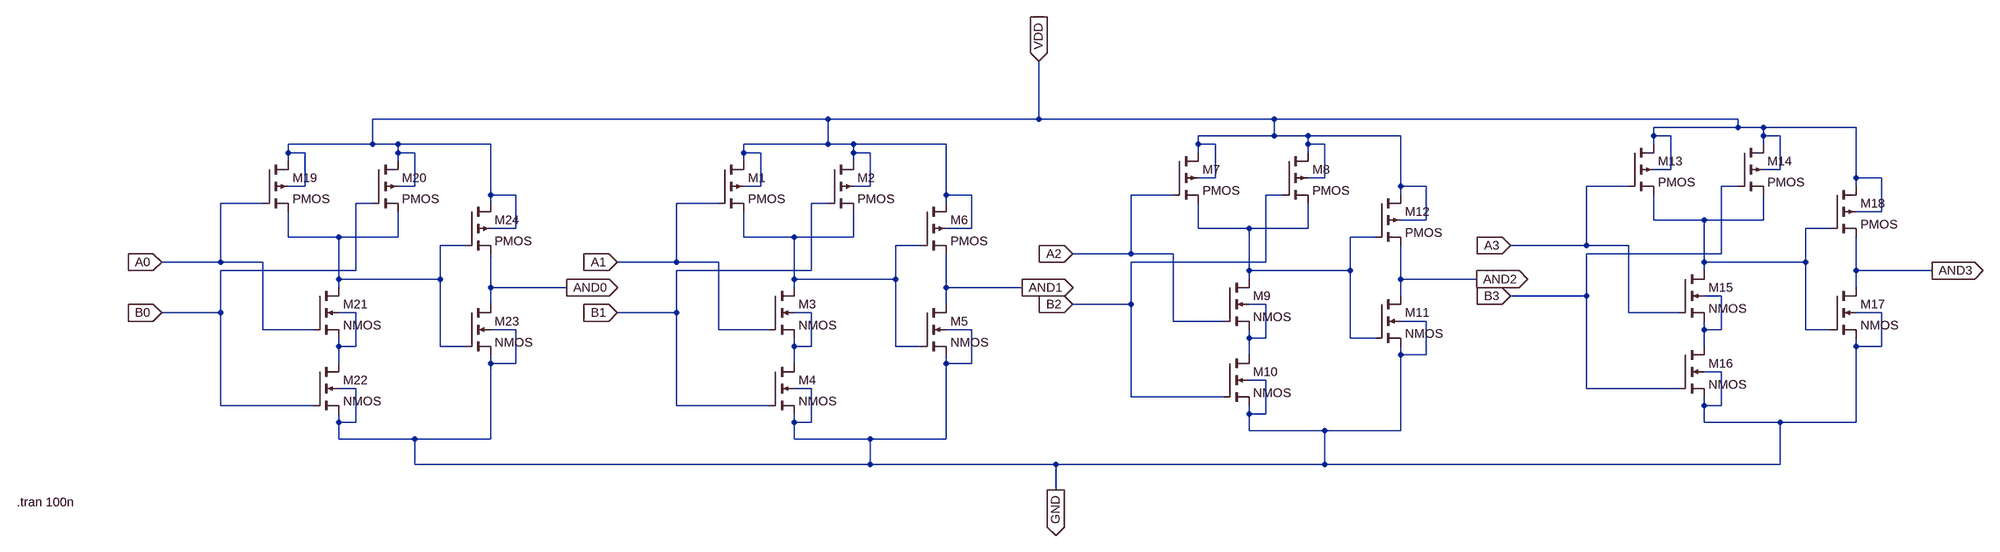
[diagram p0: schematic 4bit_And.asc]
4bit_And.asc, the LTspice schematic file:
Version 4.1
SHEET 1 2444 752
WIRE 192 -64 -704 -64
WIRE 592 -64 592 -304
WIRE 592 -64 192 -64
WIRE 1072 -64 592 -64
WIRE 1952 -64 1072 -64
WIRE 1952 -48 1952 -64
WIRE 1952 -48 1792 -48
WIRE 2000 -48 1952 -48
WIRE 2176 -48 2000 -48
WIRE 1072 -32 1072 -64
WIRE 1072 -32 928 -32
WIRE 1136 -32 1072 -32
WIRE 1312 -32 1136 -32
WIRE 1792 -32 1792 -48
WIRE 1824 -32 1792 -32
WIRE 2000 -32 2000 -48
WIRE 2032 -32 2000 -32
WIRE -704 -16 -704 -64
WIRE -704 -16 -864 -16
WIRE -656 -16 -704 -16
WIRE -480 -16 -656 -16
WIRE 192 -16 192 -64
WIRE 192 -16 32 -16
WIRE 240 -16 192 -16
WIRE 416 -16 240 -16
WIRE 928 -16 928 -32
WIRE 960 -16 928 -16
WIRE 1136 -16 1136 -32
WIRE 1168 -16 1136 -16
WIRE 1792 -16 1792 -32
WIRE 2000 -16 2000 -32
WIRE -864 0 -864 -16
WIRE -832 0 -864 0
WIRE -656 0 -656 -16
WIRE -624 0 -656 0
WIRE 32 0 32 -16
WIRE 64 0 32 0
WIRE 240 0 240 -16
WIRE 272 0 240 0
WIRE 928 0 928 -16
WIRE 1136 0 1136 -16
WIRE -864 16 -864 0
WIRE -656 16 -656 0
WIRE 32 16 32 0
WIRE 240 16 240 0
WIRE 1824 32 1824 -32
WIRE 1824 32 1792 32
WIRE 2032 32 2032 -32
WIRE 2032 32 2000 32
WIRE 960 48 960 -16
WIRE 960 48 928 48
WIRE 1168 48 1168 -16
WIRE 1168 48 1136 48
WIRE 2176 48 2176 -48
WIRE 2224 48 2176 48
WIRE -832 64 -832 0
WIRE -832 64 -864 64
WIRE -624 64 -624 0
WIRE -624 64 -656 64
WIRE 64 64 64 0
WIRE 64 64 32 64
WIRE 272 64 272 0
WIRE 272 64 240 64
WIRE 1312 64 1312 -32
WIRE 1360 64 1312 64
WIRE 1744 64 1664 64
WIRE 1952 64 1920 64
WIRE 2176 64 2176 48
WIRE -480 80 -480 -16
WIRE -432 80 -480 80
WIRE 416 80 416 -16
WIRE 464 80 416 80
WIRE 880 80 800 80
WIRE 1088 80 1056 80
WIRE 1312 80 1312 64
WIRE -912 96 -992 96
WIRE -704 96 -736 96
WIRE -480 96 -480 80
WIRE -16 96 -96 96
WIRE 192 96 160 96
WIRE 416 96 416 80
WIRE 2224 112 2224 48
WIRE 2224 112 2176 112
WIRE 1360 128 1360 64
WIRE 1360 128 1312 128
WIRE 1792 128 1792 80
WIRE 1888 128 1792 128
WIRE 2000 128 2000 80
WIRE 2000 128 1888 128
WIRE -432 144 -432 80
WIRE -432 144 -480 144
WIRE 464 144 464 80
WIRE 464 144 416 144
WIRE 928 144 928 96
WIRE 1024 144 928 144
WIRE 1136 144 1136 96
WIRE 1136 144 1024 144
WIRE 2128 144 2080 144
WIRE -864 160 -864 112
WIRE -768 160 -864 160
WIRE -656 160 -656 112
WIRE -656 160 -768 160
WIRE 32 160 32 112
WIRE 128 160 32 160
WIRE 240 160 240 112
WIRE 240 160 128 160
WIRE 1264 160 1216 160
WIRE -528 176 -576 176
WIRE 368 176 320 176
WIRE 1664 176 1664 64
WIRE 1664 176 1520 176
WIRE 1744 176 1664 176
WIRE 800 192 800 80
WIRE 800 192 656 192
WIRE 880 192 800 192
WIRE 1920 192 1920 64
WIRE 1920 192 1664 192
WIRE -992 208 -992 96
WIRE -992 208 -1136 208
WIRE -912 208 -992 208
WIRE -96 208 -96 96
WIRE -96 208 -240 208
WIRE -16 208 -96 208
WIRE 1056 208 1056 80
WIRE 1056 208 800 208
WIRE 1888 208 1888 128
WIRE 2080 208 2080 144
WIRE 2080 208 1888 208
WIRE -736 224 -736 96
WIRE -736 224 -992 224
WIRE 160 224 160 96
WIRE 160 224 -96 224
WIRE 1024 224 1024 144
WIRE 1216 224 1216 160
WIRE 1216 224 1024 224
WIRE 1888 224 1888 208
WIRE 2176 224 2176 160
WIRE 2320 224 2176 224
WIRE -768 240 -768 160
WIRE -576 240 -576 176
WIRE -576 240 -768 240
WIRE 128 240 128 160
WIRE 320 240 320 176
WIRE 320 240 128 240
WIRE 1024 240 1024 224
WIRE 1312 240 1312 176
WIRE 1456 240 1312 240
WIRE -768 256 -768 240
WIRE -480 256 -480 192
WIRE -336 256 -480 256
WIRE 128 256 128 240
WIRE 416 256 416 192
WIRE 560 256 416 256
WIRE 2176 256 2176 224
WIRE 1312 272 1312 240
WIRE 1664 272 1664 192
WIRE 1664 272 1520 272
WIRE 1920 272 1888 272
WIRE -480 288 -480 256
WIRE 416 288 416 256
WIRE 800 288 800 208
WIRE 800 288 656 288
WIRE 1056 288 1024 288
WIRE -992 304 -992 224
WIRE -992 304 -1136 304
WIRE -736 304 -768 304
WIRE -96 304 -96 224
WIRE -96 304 -240 304
WIRE 160 304 128 304
WIRE 1744 304 1744 176
WIRE 1840 304 1744 304
WIRE 2224 304 2176 304
WIRE 880 320 880 192
WIRE 976 320 880 320
WIRE 1360 320 1312 320
WIRE -912 336 -912 208
WIRE -816 336 -912 336
WIRE -432 336 -480 336
WIRE -16 336 -16 208
WIRE 80 336 -16 336
WIRE 464 336 416 336
WIRE 1888 336 1888 320
WIRE 1920 336 1920 272
WIRE 1920 336 1888 336
WIRE 2080 336 2080 208
WIRE 2128 336 2080 336
WIRE 1024 352 1024 336
WIRE 1056 352 1056 288
WIRE 1056 352 1024 352
WIRE 1216 352 1216 224
WIRE 1264 352 1216 352
WIRE -768 368 -768 352
WIRE -736 368 -736 304
WIRE -736 368 -768 368
WIRE -576 368 -576 240
WIRE -528 368 -576 368
WIRE 128 368 128 352
WIRE 160 368 160 304
WIRE 160 368 128 368
WIRE 320 368 320 240
WIRE 368 368 320 368
WIRE 1888 368 1888 336
WIRE 2176 368 2176 352
WIRE 2224 368 2224 304
WIRE 2224 368 2176 368
WIRE 1024 384 1024 352
WIRE 1312 384 1312 368
WIRE 1360 384 1360 320
WIRE 1360 384 1312 384
WIRE -768 400 -768 368
WIRE -480 400 -480 384
WIRE -432 400 -432 336
WIRE -432 400 -480 400
WIRE 128 400 128 368
WIRE 416 400 416 384
WIRE 464 400 464 336
WIRE 464 400 416 400
WIRE 1920 416 1888 416
WIRE 1056 432 1024 432
WIRE -736 448 -768 448
WIRE 160 448 128 448
WIRE 1664 448 1664 272
WIRE 1840 448 1664 448
WIRE 800 464 800 288
WIRE 976 464 800 464
WIRE -992 480 -992 304
WIRE -816 480 -992 480
WIRE -96 480 -96 304
WIRE 80 480 -96 480
WIRE 1888 480 1888 464
WIRE 1920 480 1920 416
WIRE 1920 480 1888 480
WIRE 1024 496 1024 480
WIRE 1056 496 1056 432
WIRE 1056 496 1024 496
WIRE -768 512 -768 496
WIRE -736 512 -736 448
WIRE -736 512 -768 512
WIRE 128 512 128 496
WIRE 160 512 160 448
WIRE 160 512 128 512
WIRE 1888 512 1888 480
WIRE 2032 512 1888 512
WIRE 2176 512 2176 368
WIRE 2176 512 2032 512
WIRE 1024 528 1024 496
WIRE 1168 528 1024 528
WIRE 1312 528 1312 384
WIRE 1312 528 1168 528
WIRE -768 544 -768 512
WIRE -624 544 -768 544
WIRE -480 544 -480 400
WIRE -480 544 -624 544
WIRE 128 544 128 512
WIRE 272 544 128 544
WIRE 416 544 416 400
WIRE 416 544 272 544
WIRE -624 592 -624 544
WIRE 272 592 272 544
WIRE 272 592 -624 592
WIRE 624 592 272 592
WIRE 1168 592 1168 528
WIRE 1168 592 624 592
WIRE 2032 592 2032 512
WIRE 2032 592 1168 592
WIRE 624 640 624 592
FLAG -240 208 A1
IOPIN -240 208 In
FLAG -240 304 B1
IOPIN -240 304 In
FLAG 656 192 A2
IOPIN 656 192 In
FLAG 656 288 B2
IOPIN 656 288 In
FLAG 1520 176 A3
IOPIN 1520 176 In
FLAG 1520 272 B3
IOPIN 1520 272 In
FLAG -1136 208 A0
IOPIN -1136 208 In
FLAG -1136 304 B0
IOPIN -1136 304 In
FLAG -336 256 AND0
IOPIN -336 256 Out
FLAG 560 256 AND1
IOPIN 560 256 Out
FLAG 1456 240 AND2
IOPIN 1456 240 Out
FLAG 2320 224 AND3
IOPIN 2320 224 Out
FLAG 592 -304 VDD
IOPIN 592 -304 In
FLAG 624 640 GND
IOPIN 624 640 Out
SYMBOL pmos4 -16 16 R0
SYMATTR InstName M1
SYMBOL pmos4 192 16 R0
SYMATTR InstName M2
SYMBOL nmos4 80 256 R0
SYMATTR InstName M3
SYMBOL nmos4 80 400 R0
SYMATTR InstName M4
SYMBOL nmos4 368 288 R0
SYMATTR InstName M5
SYMBOL pmos4 368 96 R0
SYMATTR InstName M6
SYMBOL pmos4 880 0 R0
SYMATTR InstName M7
SYMBOL pmos4 1088 0 R0
SYMATTR InstName M8
SYMBOL nmos4 976 240 R0
SYMATTR InstName M9
SYMBOL nmos4 976 384 R0
SYMATTR InstName M10
SYMBOL nmos4 1264 272 R0
SYMATTR InstName M11
SYMBOL pmos4 1264 80 R0
SYMATTR InstName M12
SYMBOL pmos4 1744 -16 R0
SYMATTR InstName M13
SYMBOL pmos4 1952 -16 R0
SYMATTR InstName M14
SYMBOL nmos4 1840 224 R0
SYMATTR InstName M15
SYMBOL nmos4 1840 368 R0
SYMATTR InstName M16
SYMBOL nmos4 2128 256 R0
SYMATTR InstName M17
SYMBOL pmos4 2128 64 R0
SYMATTR InstName M18
SYMBOL pmos4 -912 16 R0
SYMATTR InstName M19
SYMBOL pmos4 -704 16 R0
SYMATTR InstName M20
SYMBOL nmos4 -816 256 R0
SYMATTR InstName M21
SYMBOL nmos4 -816 400 R0
SYMATTR InstName M22
SYMBOL nmos4 -528 288 R0
SYMATTR InstName M23
SYMBOL pmos4 -528 96 R0
SYMATTR InstName M24
TEXT -2944 664 Left 2 !.tran 100n

The netlist it stands for:
* 4bit_And.asc
M1 VDD A1 N004 VDD PMOS
M2 VDD B1 N004 VDD PMOS
M3 N004 A1 N008 N008 NMOS
M4 N008 B1 GND GND NMOS
M5 AND1 N004 GND GND NMOS
M6 VDD N004 AND1 VDD PMOS
M7 VDD A2 N002 VDD PMOS
M8 VDD B2 N002 VDD PMOS
M9 N002 A2 N006 N006 NMOS
M10 N006 B2 GND GND NMOS
M11 AND2 N002 GND GND NMOS
M12 VDD N002 AND2 VDD PMOS
M13 VDD A3 N001 VDD PMOS
M14 VDD B3 N001 VDD PMOS
M15 N001 A3 N005 N005 NMOS
M16 N005 B3 GND GND NMOS
M17 AND3 N001 GND GND NMOS
M18 VDD N001 AND3 VDD PMOS
M19 VDD A0 N003 VDD PMOS
M20 VDD B0 N003 VDD PMOS
M21 N003 A0 N007 N007 NMOS
M22 N007 B0 GND GND NMOS
M23 AND0 N003 GND GND NMOS
M24 VDD N003 AND0 VDD PMOS
.model NMOS NMOS
.model PMOS PMOS
.lib standard.mos
.tran 100n
.backanno
.end